# Altium schematic sheet LED-Sheet.SchDoc
size A4; SheetNumber: 4; SheetTotal: 4
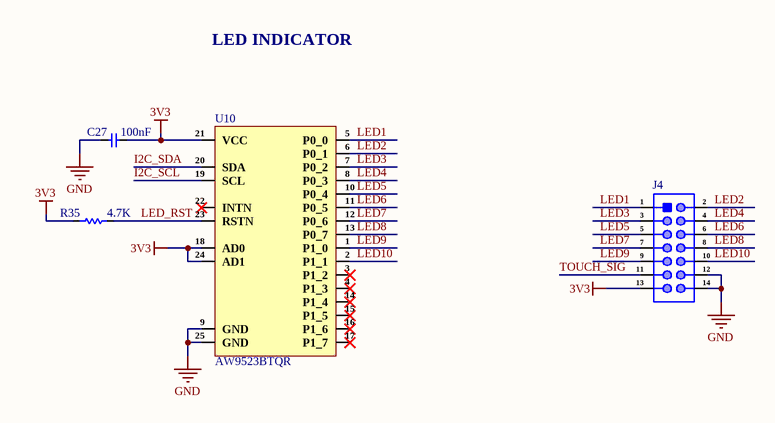
[diagram p0: LED-Sheet.SchDoc]

## Parts
C27  100nF  [Cap-0402]
J4  P125-1207A0BR138A1  [P125-1207A0BR138A1]  (value not drawn)
R35  4.7K  [Res-0402]
U10  AW9523BTQR  [TQFN-24-EP(4x4)]

## Nets
3V3: C27.1 J4.13 R35.2 U10.18(AD0) U10.21(VCC) U10.24(AD1)
GND: C27.2 J4.12 J4.14 U10.9(GND) U10.25(GND)
I2C_SCL: U10.19(SCL)
I2C_SDA: U10.20(SDA)
LED1: J4.1 U10.5(P0_0)
LED2: J4.2 U10.6(P0_1)
LED3: J4.3 U10.7(P0_2)
LED4: J4.4 U10.8(P0_3)
LED5: J4.5 U10.10(P0_4)
LED6: J4.6 U10.11(P0_5)
LED7: J4.7 U10.12(P0_6)
LED8: J4.8 U10.13(P0_7)
LED9: J4.9 U10.1(P1_0)
LED10: J4.10 U10.2(P1_1)
LED_RST: R35.1 U10.23(RSTN)
TOUCH_SIG: J4.11

Not connected (* = marked no-connect by the designer): U10 3(P1_2)* 4(P1_3)* 14(P1_4)* 15(P1_5)* 16(P1_6)* 17(P1_7)* 22(INTN)*

## Notes on the sheet
- LED INDICATOR
- File:
- Title:
- Date:
- Page
- Num:
- Total:
- Drawn By: Huzaifa Ali

## Library data of the parts
C27 = CC0402KRX5R7BB104: CAP CER 0.1UF 16V X5R 0402; Manufacturer: Yageo; Tolerance: 10%; Supplier 1: Mouser; Manufacturer Part Number: CC0402KRX5R7BB104; RoHS: Yes; Category: Ceramic Capacitors; Stock 1: 936792; Pricing 1: 1=0.10000, 10=0.02300, 50=0.02300, 100=0.01100, 1000=0.00600, 10000=0.00400 (USD); Mount: Surface Mount; Case/Package: 0402; Number of Pins: 2; Case Code (Metric): 1005; Case Code (Imperial): 0402; Min Operating Temperature: -55°C; Max Operating Temperature: 85°C; Capacitance: 100nF; Dielectric: X5R; Packaging: Tape and Reel; Voltage Rating: 16V; Package Quantity: 1; Voltage Rating (DC): 16V; Termination: SMD/SMT; Resistor Type: Ceramic; Series: CC; Construction: Flat; Length: 1mm; Width: 0.02inch; Height: 0.5mm; Thickness: 0.022inch; Depth: 0.5mm; Radiation Hardening: No; REACH SVHC: Unknown; Lead Free: Lead Free; Halogen Free: Halogen Free; RoHS Compliant: Yes; ComponentLink1URL: https://datasheet.ciiva.com/155/mlccorderingcode-155879.pdf?src-supplier=Digi-Key; ComponentLink1Description: https://datasheet.ciiva.com/155/mlccorderingcode-155879.pdf?src-supplier=Digi-Key; ComponentLink2URL: https://datasheet.ciiva.com/155/mlccorderingcode-155878.pdf?src-supplier=Digi-Key; ComponentLink2Description: https://datasheet.ciiva.com/155/mlccorderingcode-155878.pdf?src-supplier=Digi-Key; ComponentLink3URL: https://datasheet.ciiva.com/155/mlccorderingcode-155880.pdf?src-supplier=Digi-Key; ComponentLink3Description: https://datasheet.ciiva.com/155/mlccorderingcode-155880.pdf?src-supplier=Digi-Key; ComponentLink4URL: https://datasheet.ciiva.com/11464/upy-gphc-x5r-4v-to-50v-12-11464869.pdf?src-supplier=Avnet; ComponentLink4Description: https://datasheet.ciiva.com/11464/upy-gphc-x5r-4v-to-50v-12-11464869.pdf?src-supplier=Avnet; Supplier Part Number 1: 603-CC402KRX5R7BB104; LCSC Part Number: C106204
J4 = P125-1207A0BR138A1: Gold Bend insert Policy 2.5mm 6mm 14P -40℃~+105℃ 2.54mm Brass Double Row Black 2x7P 2.54mm Push-Pull,P=2.54mm Pin Headers ROHS; Manufacturer: Yxcon; Manufacturer Part Number: P125-1207A0BR138A1; Package: Push-Pull,P=2.54mm; LCSC Part Number: C19190502; Item Type: Pin Header; ComponentLink1Description: LCSC; ComponentLink1URL: https://www.lcsc.com/product-detail/Pin-Headers_Yxcon-P125-1207A0BR138A1_C19190502.html
R35 = RC0402FR-074K7L: RES 4.7K OHM 1% 1/16W 0402; Manufacturer: Yageo; Voltage Rating (DC): 50V; Power Rating: 62.5mW; Resistance: 4.7kR; Temperature Coefficient: 100ppm/°C; Max Power Dissipation: 63mW; Item Type: Resistor; Supplier 1: Avnet; Manufacturer Part Number: RC0402FR-074K7L; RoHS: Yes; Category: Chip SMD Resistors; Stock 1: 2420000; Pricing 1: 10000=0.00085 (USD); Case/Package: 0402; Number of Pins: 2; Case Code (Imperial): 0402; Case Code (Metric): 1005; Size Code: 0402; Min Operating Temperature: -55°C; Max Operating Temperature: 155°C; Tolerance: 1%; Voltage Rating: 50V; Packaging: Tape and Reel; Resistor Type: Thick Film; Termination: SMD/SMT; Features: Moisture Resistant; Series: RC; Number of Terminations: 2; Resistance Tolerance: 1%; Construction: Rectangular; Length: 1mm; Width: 0.5mm; Height: 0.32mm; Depth: 0.5mm; Height - Seated (Max): 0.016inch; RoHS Compliant: Yes; Reach SVHC Compliant: Yes; Military Standard: Not; Lead Free: Lead Free; ComponentLink1URL: https://datasheet.ciiva.com/22661/1686128-22661342.pdf?src-supplier=Element14; ComponentLink1Description: https://datasheet.ciiva.com/22661/1686128-22661342.pdf?src-supplier=Element14; ComponentLink2URL: https://datasheet.ciiva.com/7850/1018594-7850022.pdf?src-supplier=Element14; ComponentLink2Description: https://datasheet.ciiva.com/7850/1018594-7850022.pdf?src-supplier=Element14; ComponentLink3URL: https://datasheet.ciiva.com/7850/1018594-7850023.pdf?src-supplier=Element14; ComponentLink3Description: https://datasheet.ciiva.com/7850/1018594-7850023.pdf?src-supplier=Element14; ComponentLink4URL: https://datasheet.ciiva.com/15215/getdatasheetpartid-328119-15215035.pdf?src-supplier=Verical; ComponentLink4Description: https://datasheet.ciiva.com/15215/getdatasheetpartid-328119-15215035.pdf?src-supplier=Verical; Supplier Part Number 1: RC0402FR-074K7L; LCSC Part Number: C105871
U10 = AW9523BTQR: 16 400kHz I2C TQFN-24-EP(4x4) I/O Expanders ROHS; Manufacturer: AWINIC; Item Type: IC; Manufacturer Part Number: AW9523BTQR; Package: TQFN-24-EP(4x4); LCSC Part Number: C148077; ComponentLink1Description: LCSC; ComponentLink1URL: https://www.lcsc.com/product-detail/I-O-Expanders_AWINIC-Shanghai-Awinic-Tech-AW9523BTQR_C148077.html